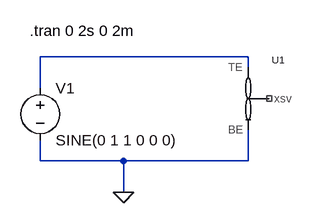
[diagram p0: schematic memristor_sym.asc]
memristor_sym.asc, the LTspice schematic file:
Version 4.1
SHEET 1 880 680
WIRE 352 80 32 80
WIRE 352 96 352 80
WIRE 32 128 32 80
WIRE 32 240 32 208
WIRE 160 240 32 240
WIRE 352 240 352 192
WIRE 352 240 160 240
WIRE 160 288 160 240
FLAG 160 288 0
SYMBOL memristor 352 144 R0
SYMATTR InstName U1
SYMBOL voltage 32 112 R0
WINDOW 123 0 0 Left 0
WINDOW 39 0 0 Left 0
SYMATTR InstName V1
SYMATTR Value SINE(0 1 1 0 0 0)
TEXT 16 40 Left 2 !.tran 0 2s 0 2m

The netlist it stands for:
* memristor_sym.asc
X§U1 N001 0 NC_01 memristor  ; pins TE BE xsv
V1 N001 0 SINE(0 1 1 0 0 0)
.tran 0 2s 0 2m
.backanno
.end